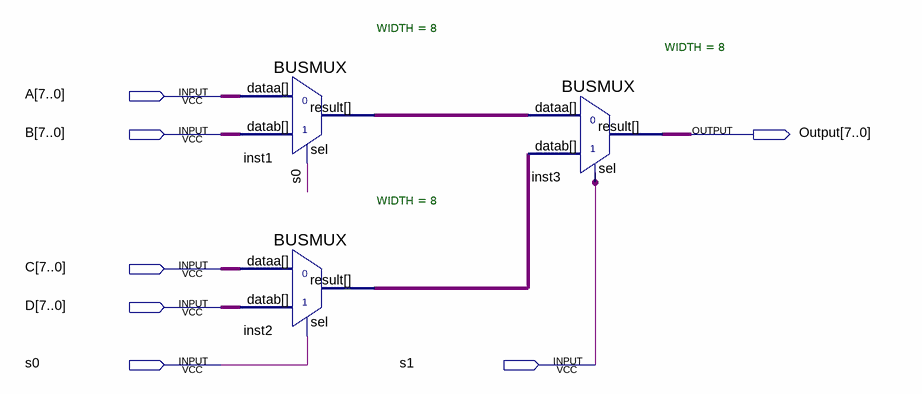
[diagram p0: schematic sheet]
// Quartus schematic 8bit-Mux.bdf as structural Verilog: 3 symbols, 7 pins
module \8bit-Mux  (
  input  [7:0] A,
  input  [7:0] B,
  input  [7:0] C,
  input  [7:0] D,
  input  s0,
  input  s1,
  output [7:0] Output
);

  wire [7:0] inst1_result, inst2_result;

  BUSMUX #(.WIDTH(8)) inst1 (.datab(B), .sel(s0), .dataa(A), .result(inst1_result));
  BUSMUX #(.WIDTH(8)) inst2 (.datab(D), .sel(s0), .dataa(C), .result(inst2_result));
  BUSMUX #(.WIDTH(8)) inst3 (.datab(inst2_result), .sel(s1), .dataa(inst1_result), .result(Output));
endmodule
